# EasyEDA Pro project PCB.epro

# Schematic Schematic1
Board Name: Board1; Create Date: 2026-11-01; Page Name: P1; Project Name: hacker card 2.0; Schematic Name: Schematic1; Update Date: 2026-11-01; Company: EasyEDA.com; Page Size: A4; Version: V1.0
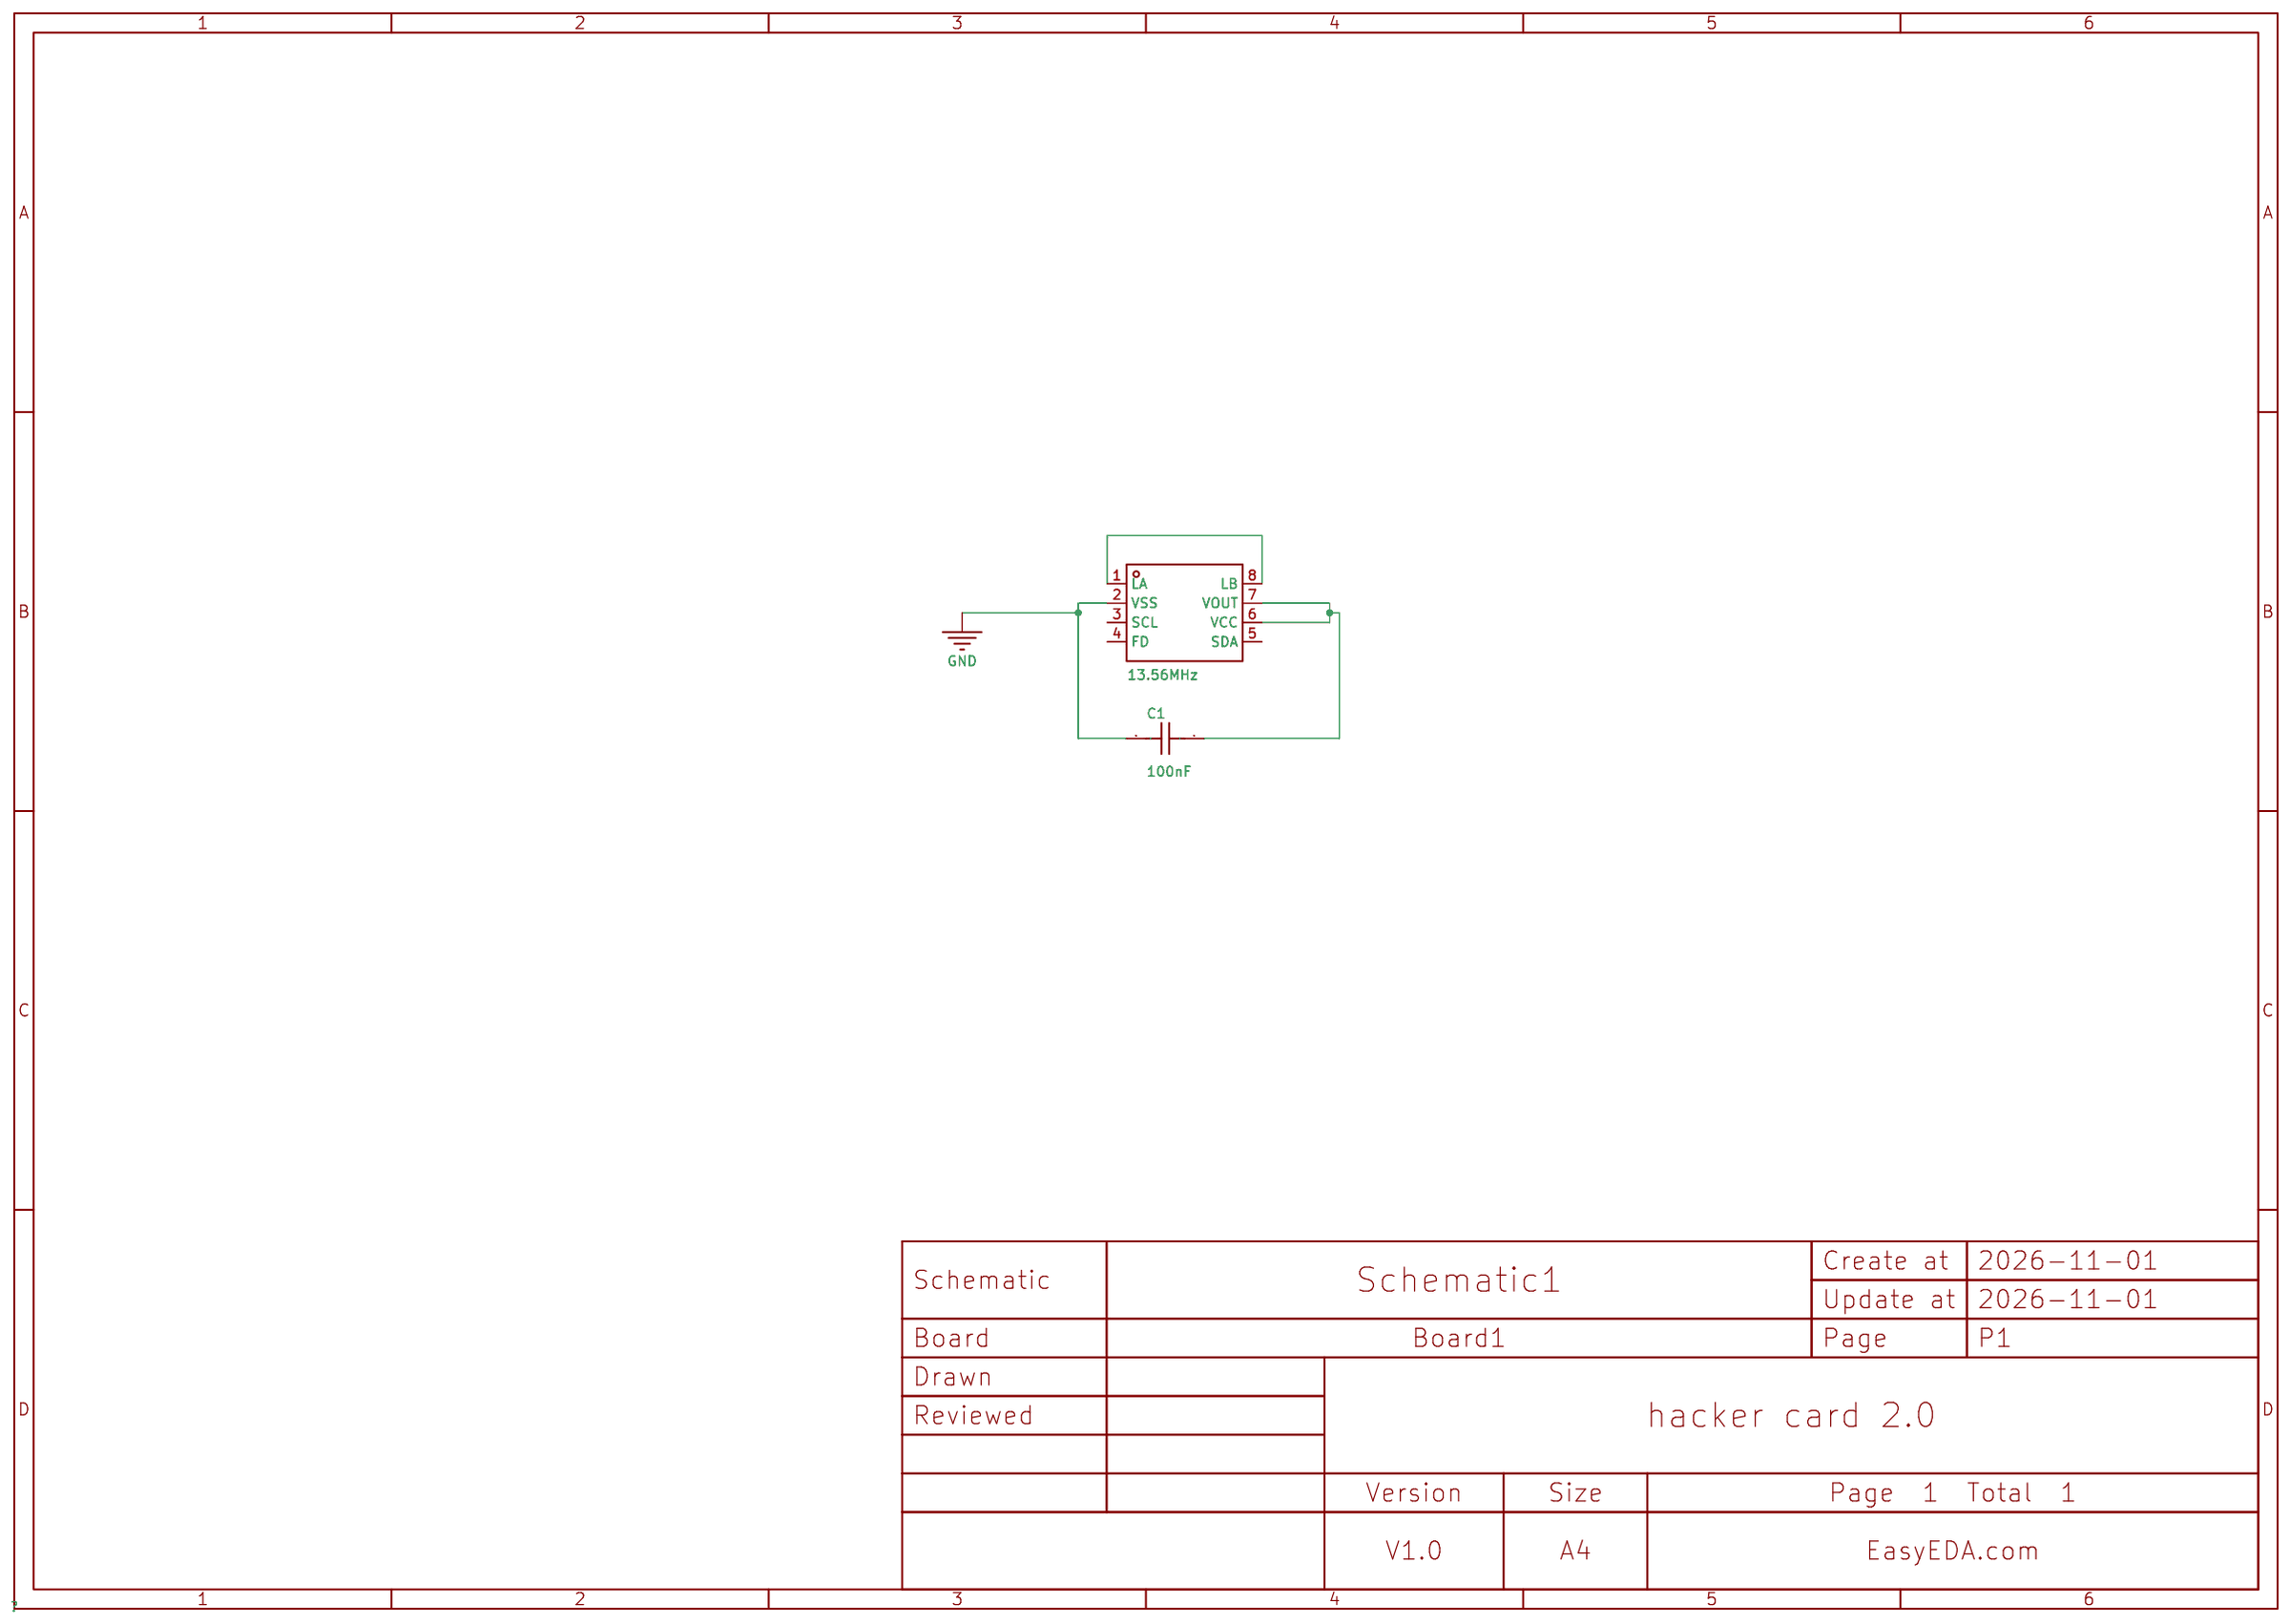
[diagram p0: schematic sheet]

## Parts
C1  100nF  [C0603]
U1  13.56MHz  [TSSOP-8_L3.0-W3.0-P0.65-LS4.9-BL]

## Library data of the parts
C1 = CAP_0603: Supplier Footprint: 0603
U1 = NT3H2111W0FTTJ: agreement:ISO 14443,ISO 14443A,NFC Interface:I2C transmission rate:106Kbit/s Frequency:13.56MHz Frequency:13.56MHz Voltage - Supply:3.3V Voltage - Supply:3.3V Features:Energy harvesting；Built-in non-volatile memory；Data verification; LCSC Part Name: NFC Forum T2T 带 I²C 接口、密码保护和能量收集; Supplier Part: C2654884; Manufacturer: NXP(恩智浦); Supplier Footprint: MSOP-8; JLCPCB Part Class: Extended Part; Datasheet: https://www.nxp.com/docs/en/data-sheet/NT3H2111_2211.pdf; Supplier: LCSC; agreement: ISO 14443,ISO 14443A,NFC; Interface: I2C; transmission rate: 106Kbit/s; Voltage - Supply: 3.3V; Features: Energy harvesting；Built-in non-volatile memory；Data verification

## Nets
GND: C1.2 U1.2(VSS)
$1N1: U1.1(LA) U1.8(LB)
$1N3: C1.1 U1.6(VCC) U1.7(VOUT)

Not connected (* = marked no-connect by the designer): U1 3(SCL) 4(FD) 5(SDA)

# Board PCB1
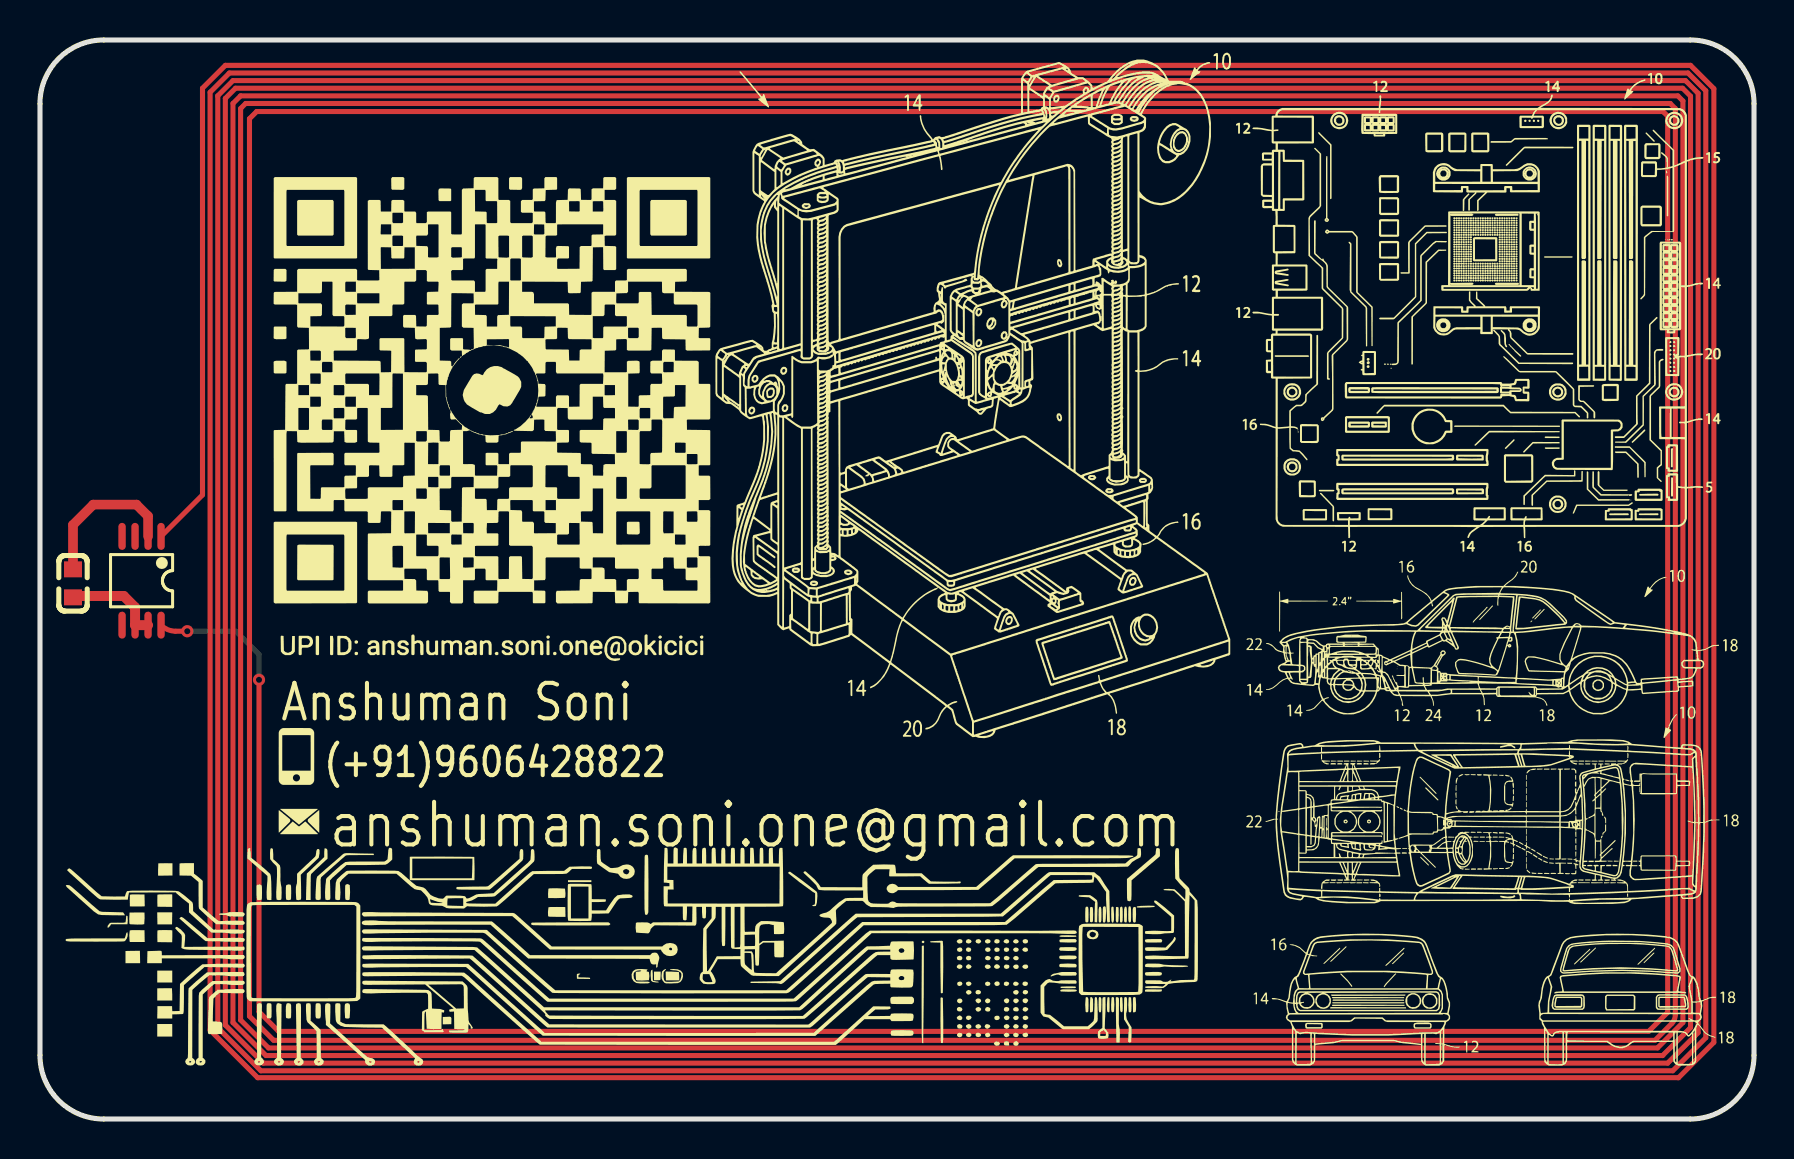
[diagram p1: board, top side]
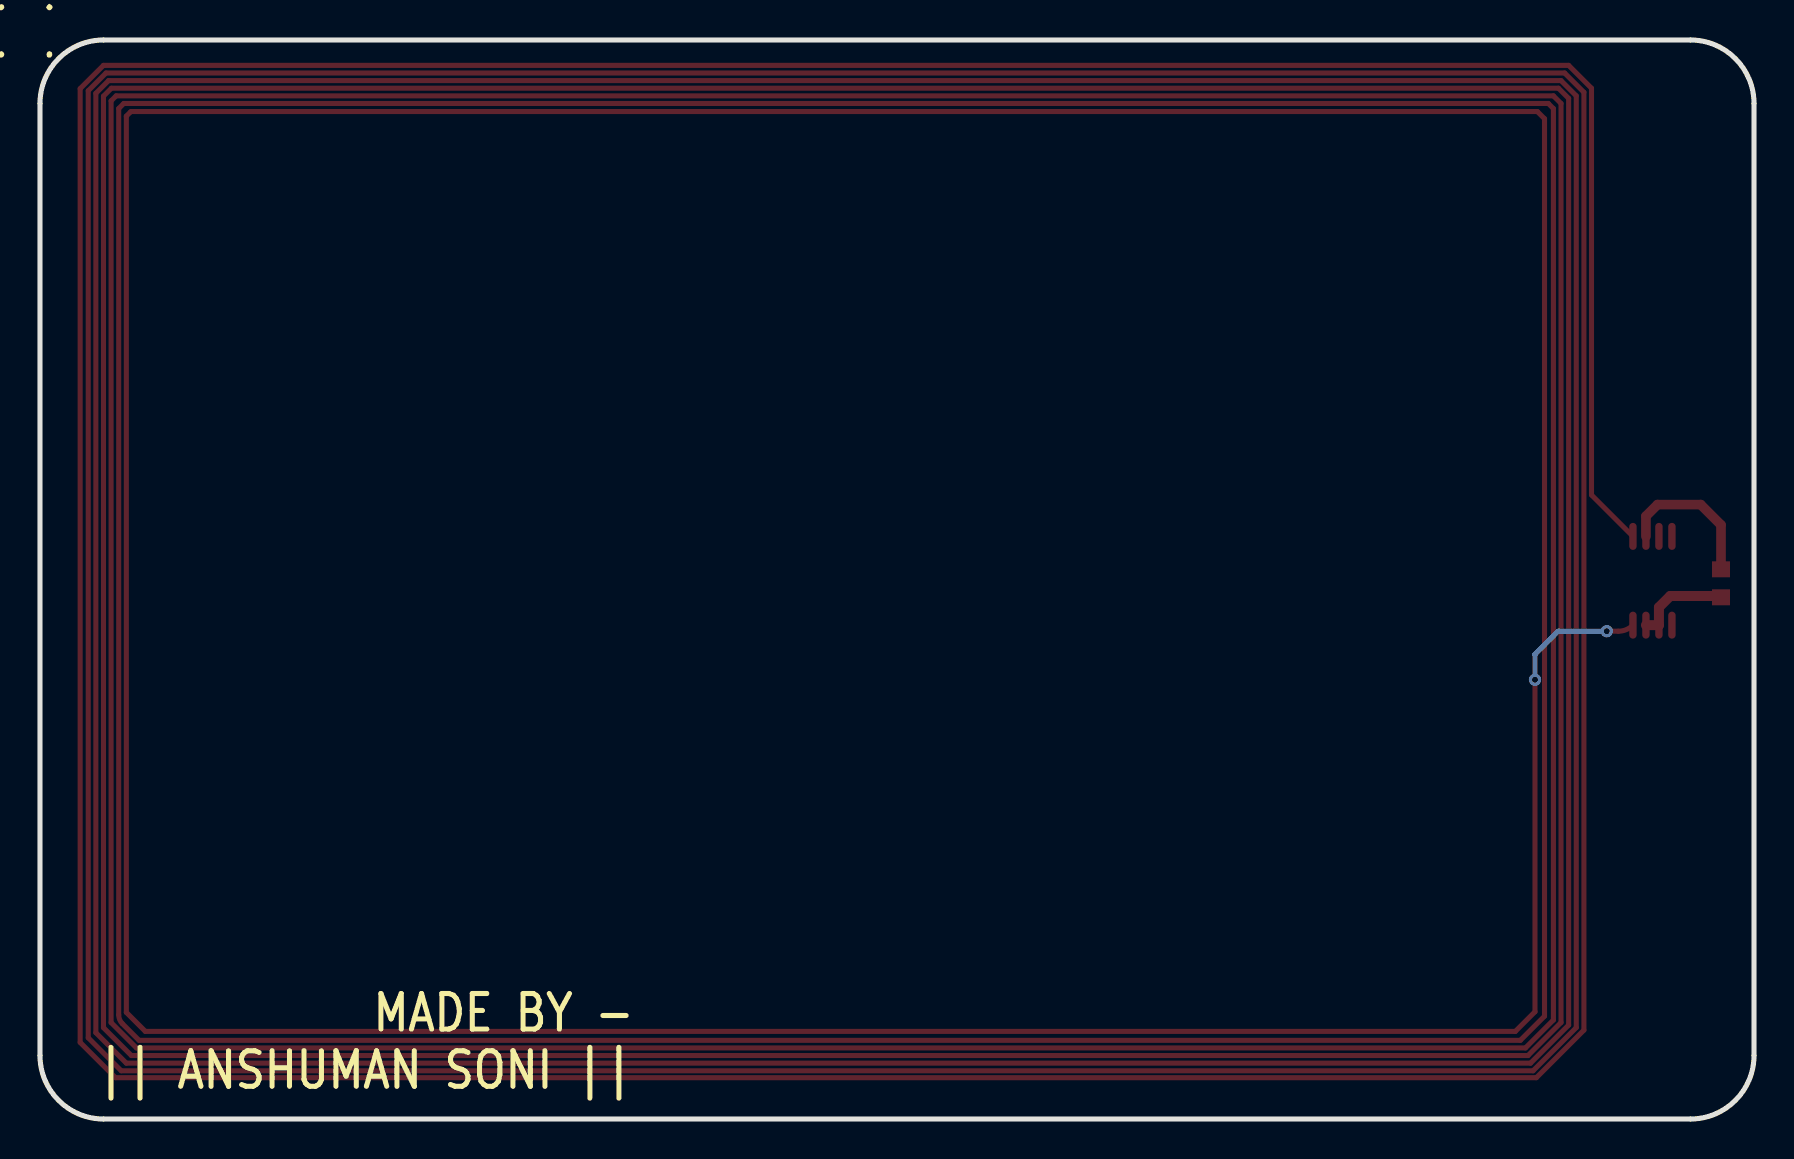
[diagram p2: board, bottom side, seen from below]

Outline 85.72 x 53.97 mm; copper layers: Top Layer, Bottom Layer. Coordinates in mm from the lower left corner of the outline.
Outline path: 0,50.8 0,3.18 arc(0.93,0.93) 3.18,0 82.55,0 arc(84.79,0.93) 85.72,3.18 85.72,50.8 arc(84.79,53.04) 82.55,53.97 3.18,53.97 arc(0.93,53.04) 0,50.8
Stack: Top Layer 0.035mm / Dielectric1 1.51mm FR4 er 4.5 / Bottom Layer 0.035mm

## Design rules (mm)
spacing copperThickness1oz (default): track to track 0.102, other pairs 0.152 to 0.3
spacing copperThickness2oz: track to track 0.203, other pairs 0.152 to 0.3
track width copperThickness1oz (default): min 0.127, default 0.254, max 2.54
track width copperThickness2oz: min 0.203, default 0.254, max 2.54
differential pair differentialPair (default): width min 0.127, default 0.254, max 2.54; gap min 0.152, default 0.152
net GND uses copperRegion

## Placement (name value [footprint] x y rotation side)
C1  100nF  [C0603]  1.65 26.8 90 top
U1  13.56MHz  [TSSOP-8_L3.0-W3.0-P0.65-LS4.9-BL]  5.08 26.92 180 top

## Footprints (pads in the part's own frame, mm; a bottom-side part is the same pattern mirrored in y, then rotated)
C0603
  rect 0.8x0.9 smd: 1(-0.7,0) 2(0.7,0)
TSSOP-8_L3.0-W3.0-P0.65-LS4.9-BL
  oval 0.37x1.35 smd: 1(-0.975,-2.22) 2(-0.325,-2.22) 3(0.325,-2.22) 4(0.975,-2.22) 5(0.975,2.22) 6(0.325,2.22) 7(-0.325,2.22) 8(-0.975,2.22)

## Nets
As in the schematic.

Pads without a net: U1 3 4 5

## Via types
v1: diameter 0.61, hole 0.305, Top Layer to Bottom Layer, 2 vias

## Routing (per net, layer and track width the routed paths; a pad name or vN(x,y) marks a point on that pad's centre or on a via; arc(x,y) is an arc through that point)
GND: length 7.6
  Top Layer w0.482: U1.2 5.41,30.16 4.83,30.73 2.67,30.73 1.65,29.72 C1.2
$1N1: length 1683.3
  Top Layer w0.254: v1(7.37,24.4) 6.79,24.4 arc(6.39,24.48) 6.06,24.7 ; v1(10.95,21.97) 10.95,5.37 11.94,4.38 80.45,4.38 81.41,5.33 81.41,50.16 81.19,50.38 arc(81.17,50.39) 81.15,50.4 10.84,50.4 10.48,50.04 10.48,5.14 11.68,3.94 80.77,3.94 81.61,4.77 arc(81.74,4.97) 81.79,5.21 81.79,50.55 81.53,50.8 10.29,50.8 10.03,50.55 10.03,4.95 11.43,3.56 80.9,3.56 82.17,4.83 82.17,50.93 81.91,51.18 10.03,51.18 9.65,50.8 9.65,4.83 11.3,3.17 81.15,3.17 82.55,4.57 82.55,51.16 82.15,51.56 9.78,51.56 9.27,51.05 9.27,4.7 11.18,2.79 81.41,2.79 82.93,4.32 82.93,51.31 82.3,51.94 9.65,51.94 8.89,51.18 8.89,4.57 11.05,2.41 81.66,2.41 83.31,4.06 83.31,51.44 82.42,52.32 9.47,52.32 8.51,51.36 8.51,4.45 10.89,2.07 81.95,2.07 83.72,3.83 83.72,51.54 82.55,52.7 9.27,52.7 8.13,51.56 8.13,31.22 6.06,29.14
  Bottom Layer w0.254: v1(7.37,24.4) 9.8,24.4 10.95,23.24 v1(10.95,21.97)
$1N3: length 4.9
  Top Layer w0.5: U1.7 U1.6 4.75,25.6 4.19,26.16 1.72,26.16 C1.1

## Text on the board
Bottom Silkscreen Layer: MADE BY - / || ANSHUMAN SONI ||
Top Silkscreen Layer: (+91)9606428822 | Anshuman Soni | anshuman.soni.one@gmail.com
